# Altium schematic sheet Buzzers.SchDoc
size A; SheetNumber: 4; SheetTotal: 6
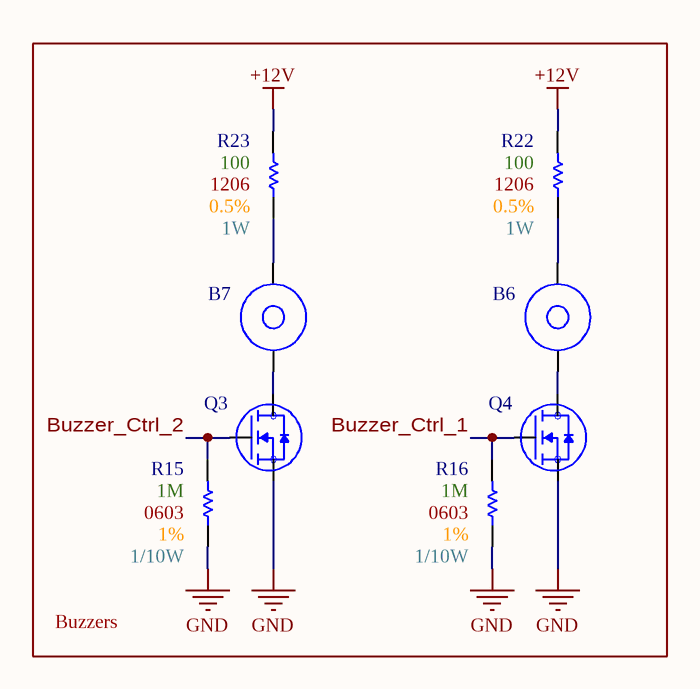
[diagram p0: Buzzers.SchDoc]

## Parts
B6  Passive buzzer  [[Buzzer] Passive SMD 12V 80mA]  (value not drawn)
B7  Passive buzzer  [[Buzzer] Passive SMD 12V 80mA]  (value not drawn)
Q3  [NMOS] SMD 20V 1.4A 160mOhm  [SOT323]  (value not drawn)
Q4  [NMOS] SMD 20V 1.4A 160mOhm  [SOT323]  (value not drawn)
R15  Wattage: 1/10W  Tolerance: 1%  Resistance: 1M  Size Package: 0603  [[Res] SMD 0603]  (hidden comment: [1M] SMD 0603 1% 1/10W)
R16  Wattage: 1/10W  Tolerance: 1%  Resistance: 1M  Size Package: 0603  [[Res] SMD 0603]  (hidden comment: [1M] SMD 0603 1% 1/10W)
R22  Wattage: 1W  Tolerance: 0.5%  Resistance: 100  Size Package: 1206  [[Res] SMD 1206]  (hidden comment: [100] SMD 1206 0.5% 1W)
R23  Wattage: 1W  Tolerance: 0.5%  Resistance: 100  Size Package: 1206  [[Res] SMD 1206]  (hidden comment: [100] SMD 1206 0.5% 1W)

## Blocks framed on the sheet
Buzzers: B6 B7 Q3 Q4 R15 R16 R22 R23

## Nets
+12V: R22.2 R23.2
GND: Q3.2(Source) Q4.2(Source) R15.1 R16.1
Buzzer_Ctrl_1: Q4.1(Gate) R16.2
Buzzer_Ctrl_2: Q3.1(Gate) R15.2
NetB6_1: B6.1(+) R22.1
NetB6_2: B6.2(-) Q4.3(Drain)
NetB7_1: B7.1(+) R23.1
NetB7_2: B7.2(-) Q3.3(Drain)

## Library data of the parts
B6 B7 = [Buzzer] Passive SMD 12V 80mA: CT08E-16S400-2; Supplier 1: DigiKey; Supplier Part Number 1: 2603-CT08E-16S400-2CT-ND
Q3 Q4 = [NMOS] SMD 20V 1.4A 160mOhm: BSS816NWH6327XTSA1; Supplier 1: DigiKey; Supplier Part Number 1: BSS816NWH6327XTSA1CT-ND
R15 R16 = [1M] SMD 0603 1% 1/10W: RC0603FR-071ML; Supplier 1: DigiKey; Supplier Part Number 1: 311-1.00MHRDKR-ND
R22 R23 = [100] SMD 1206 0.5% 1W: HRG3216P-1000-D-T1; Supplier 1: DigiKey; Supplier Part Number 1: 408-1865-1-ND